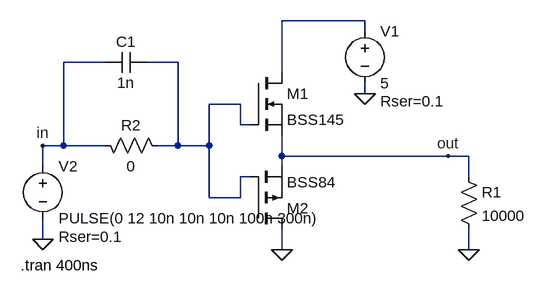
[diagram p0: schematic pull_push_mosfet.asc]
pull_push_mosfet.asc, the LTspice schematic file:
Version 4
SHEET 1 880 680
WIRE 272 -16 144 -16
WIRE 272 0 272 -16
WIRE -128 48 -192 48
WIRE -16 48 -64 48
WIRE 144 64 144 -16
WIRE 272 96 272 80
WIRE 80 112 32 112
WIRE 80 144 80 112
WIRE 96 144 80 144
WIRE -192 176 -192 48
WIRE -192 176 -224 176
WIRE -128 176 -192 176
WIRE -16 176 -16 48
WIRE -16 176 -48 176
WIRE 32 176 32 112
WIRE 32 176 -16 176
WIRE 144 192 144 160
WIRE 400 192 144 192
WIRE 432 192 400 192
WIRE -224 208 -224 176
WIRE 144 208 144 192
WIRE 96 224 80 224
WIRE 432 224 432 192
WIRE 32 256 32 176
WIRE 80 256 80 224
WIRE 80 256 32 256
WIRE -224 320 -224 288
WIRE 144 336 144 304
WIRE 432 336 432 304
FLAG 144 336 0
FLAG 272 96 0
FLAG 400 192 out
FLAG -224 320 0
FLAG -224 176 in
FLAG 432 336 0
SYMBOL voltage 272 -16 R0
WINDOW 123 0 0 Left 2
WINDOW 39 24 124 Left 2
SYMATTR InstName V1
SYMATTR Value 5
SYMATTR SpiceLine Rser=0.1
SYMBOL voltage -224 192 R0
WINDOW 123 0 0 Left 2
WINDOW 39 24 124 Left 2
SYMATTR InstName V2
SYMATTR Value PULSE(0 12 10n 10n 10n 100n 300n)
SYMATTR SpiceLine Rser=0.1
SYMBOL res -144 160 M90
WINDOW 0 0 56 VBottom 2
WINDOW 3 32 56 VTop 2
SYMATTR InstName R2
SYMATTR Value 0
SYMBOL cap -64 32 R90
WINDOW 0 0 32 VBottom 2
WINDOW 3 32 32 VTop 2
SYMATTR InstName C1
SYMATTR Value 1n
SYMBOL res 416 208 R0
SYMATTR InstName R1
SYMATTR Value 10000
SYMBOL nmos 96 64 R0
SYMATTR InstName M1
SYMATTR Value BSS145
SYMBOL pmos 96 304 M180
SYMATTR InstName M2
SYMATTR Value BSS84
TEXT -258 360 Left 2 !.tran 400ns

The netlist it stands for:
* pull_push_mosfet.asc
V1 N001 0 5 Rser=0.1
V2 in 0 PULSE(0 12 10n 10n 10n 100n 300n) Rser=0.1
R2 in N002 0
C1 N002 in 1n
R1 out 0 10000
M1 N001 N002 out out BSS145
M2 0 N002 out out BSS84
.model NMOS NMOS
.model PMOS PMOS
.lib standard.mos
.tran 400ns
.backanno
.end